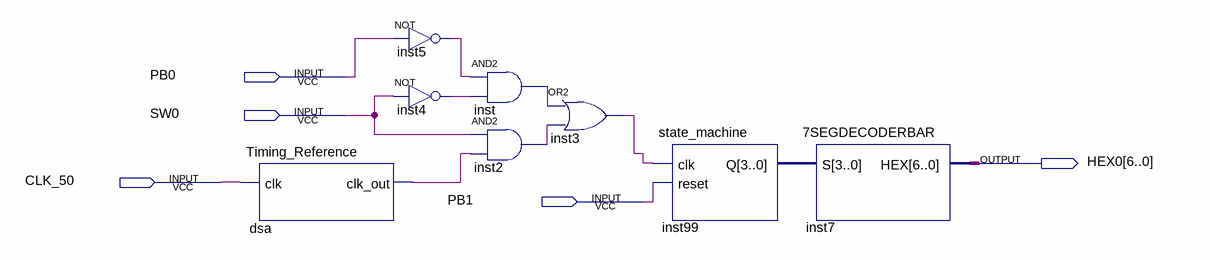
[diagram p0: schematic sheet]
// Quartus schematic LAB05.bdf as structural Verilog: 8 symbols, 5 pins
module LAB05 (
  input  PB0,
  input  SW0,
  input  CLK_50,
  input  PB1,
  output [6:0] HEX0
);

  wire dsa_clk_out, inst2_out, inst3_out, inst4_out, inst5_out, inst_out;
  wire [3:0] inst99_q;

  Timing_Reference dsa (.clk(CLK_50), .clk_out(dsa_clk_out));
  not inst5 (inst5_out, PB0);
  not inst4 (inst4_out, SW0);
  and inst (inst_out, inst5_out, inst4_out);
  and inst2 (inst2_out, SW0, dsa_clk_out);
  or inst3 (inst3_out, inst_out, inst2_out);
  state_machine inst99 (.clk(inst3_out), .reset(PB1), .Q(inst99_q));
  \7SEGDECODERBAR  inst7 (.S(inst99_q), .HEX(HEX0));
endmodule
